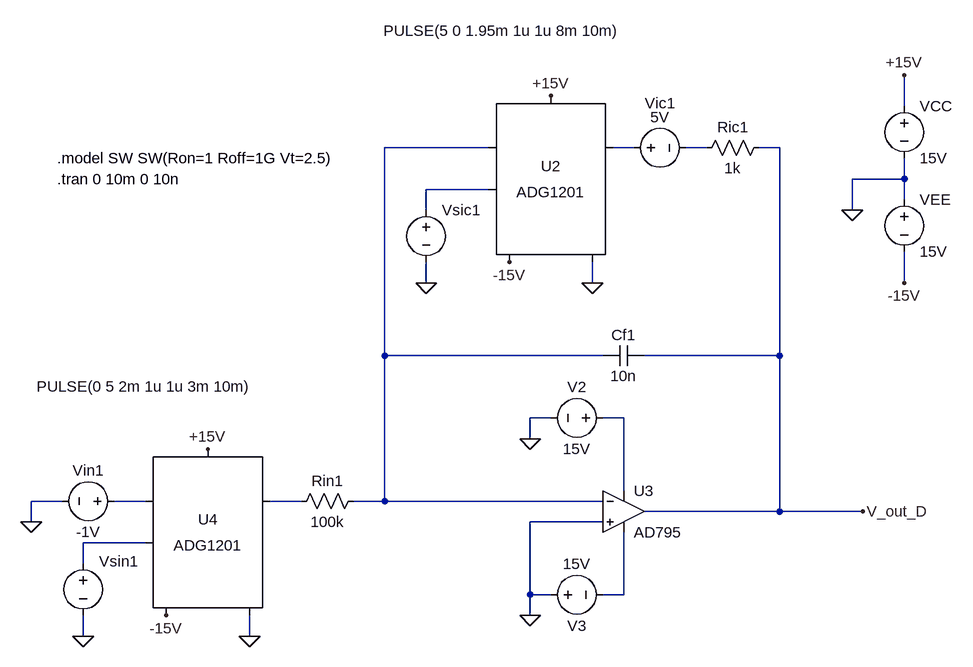
[diagram p0: schematic SIM-ANALOG-011.asc]
SIM-ANALOG-011.asc, the LTspice schematic file:
Version 4.1
SHEET 1 1720 696
WIRE 1648 -256 1648 -304
WIRE 1008 -192 848 -192
WIRE 1232 -192 1200 -192
WIRE 1344 -192 1312 -192
WIRE 1456 -192 1424 -192
WIRE 1648 -144 1648 -176
WIRE 1648 -144 1568 -144
WIRE 1008 -128 912 -128
WIRE 1648 -112 1648 -144
WIRE 912 -96 912 -128
WIRE 1568 -96 1568 -144
WIRE 912 16 912 -16
WIRE 1168 16 1168 -16
WIRE 1648 16 1648 -32
WIRE 848 128 848 -192
WIRE 1184 128 848 128
WIRE 1456 128 1456 -192
WIRE 1456 128 1248 128
WIRE 1104 224 1072 224
WIRE 1216 224 1184 224
WIRE 1072 256 1072 224
WIRE 1216 336 1216 224
WIRE 352 352 304 352
WIRE 480 352 432 352
WIRE 720 352 672 352
WIRE 848 352 848 128
WIRE 848 352 800 352
WIRE 1184 352 848 352
WIRE 1456 368 1456 128
WIRE 1456 368 1248 368
WIRE 1584 368 1456 368
WIRE 304 384 304 352
WIRE 1184 384 1072 384
WIRE 480 416 384 416
WIRE 384 448 384 416
WIRE 1072 496 1072 384
WIRE 1104 496 1072 496
WIRE 1216 496 1216 400
WIRE 1216 496 1184 496
WIRE 1072 528 1072 496
WIRE 384 560 384 528
WIRE 640 560 640 528
FLAG 1168 16 0
FLAG 912 16 0
FLAG 1072 256 0
FLAG 1072 528 0
FLAG 1584 368 V_out_D
FLAG 640 560 0
FLAG 384 560 0
FLAG 304 384 0
FLAG 1568 -96 0
FLAG 1648 16 -15V
FLAG 1648 -304 +15V
FLAG 1104 -272 +15V
FLAG 576 272 +15V
FLAG 1040 -16 -15V
FLAG 512 528 -15V
SYMBOL Switches\\ADG1201 1104 -144 R0
SYMATTR InstName U2
SYMBOL voltage 1216 -192 R270
WINDOW 0 84 56 VBottom 2
WINDOW 3 32 56 VTop 2
WINDOW 123 0 0 Left 0
WINDOW 39 0 0 Left 0
SYMATTR InstName Vic1
SYMATTR Value 5V
SYMBOL res 1440 -208 R90
WINDOW 0 0 56 VBottom 2
WINDOW 3 32 56 VTop 2
SYMATTR InstName Ric1
SYMATTR Value 1k
SYMBOL voltage 912 -112 R0
WINDOW 3 -66 -260 Left 2
WINDOW 123 0 0 Left 0
WINDOW 39 0 0 Left 0
SYMATTR InstName Vsic1
SYMATTR Value PULSE(5 0 1.95m 1u 1u 8m 10m)
SYMBOL cap 1248 112 R90
WINDOW 0 0 32 VBottom 2
WINDOW 3 32 32 VTop 2
SYMATTR InstName Cf1
SYMATTR Value 10n
SYMBOL voltage 1200 224 R90
WINDOW 0 -32 56 VBottom 2
WINDOW 3 32 56 VTop 2
WINDOW 123 0 0 Left 0
WINDOW 39 0 0 Left 0
SYMATTR InstName V2
SYMATTR Value 15V
SYMBOL OpAmps\\AD795 1216 304 R0
SYMATTR InstName U3
SYMBOL voltage 1088 496 R270
WINDOW 0 -32 56 VBottom 2
WINDOW 3 32 56 VTop 2
WINDOW 123 0 0 Left 0
WINDOW 39 0 0 Left 0
SYMATTR InstName V3
SYMATTR Value 15V
SYMBOL res 816 336 R90
WINDOW 0 0 56 VBottom 2
WINDOW 3 32 56 VTop 2
SYMATTR InstName Rin1
SYMATTR Value 100k
SYMBOL Switches\\ADG1201 576 400 R0
SYMATTR InstName U4
SYMBOL voltage 384 432 R0
WINDOW 0 55 28 Bottom 2
WINDOW 3 94 -272 Top 2
WINDOW 123 0 0 Left 0
WINDOW 39 0 0 Left 0
SYMATTR InstName Vsin1
SYMATTR Value PULSE(0 5 2m 1u 1u 3m 10m)
SYMBOL voltage 448 352 R90
WINDOW 0 -32 56 VBottom 2
WINDOW 3 32 56 VTop 2
WINDOW 123 0 0 Left 0
WINDOW 39 0 0 Left 0
SYMATTR InstName Vin1
SYMATTR Value -1V
SYMBOL voltage 1648 -272 R0
WINDOW 123 0 0 Left 0
WINDOW 39 0 0 Left 0
SYMATTR InstName VCC
SYMATTR Value 15V
SYMBOL voltage 1648 -128 R0
WINDOW 123 0 0 Left 0
WINDOW 39 0 0 Left 0
SYMATTR InstName VEE
SYMATTR Value 15V
TEXT 344 -176 Left 2 !.model SW SW(Ron=1 Roff=1G Vt=2.5)
TEXT 344 -144 Left 2 !.tran 0 10m 0 10n

The netlist it stands for:
* SIM-ANALOG-011.asc
X§U2 N004 N002 N001 -15V 0 +15V ADG1201
Vic1 N002 N003 5V
Ric1 V_out_D N003 1k
Vsic1 N004 0 PULSE(5 0 1.95m 1u 1u 8m 10m)
Cf1 V_out_D N001 10n
V2 N005 0 15V
X§U3 0 N001 N005 N009 V_out_D AD795  ; pins In+ In- V+ V- OUT
V3 0 N009 15V
Rin1 N001 N007 100k
X§U4 N008 N007 N006 -15V 0 +15V ADG1201
Vsin1 N008 0 PULSE(0 5 2m 1u 1u 3m 10m)
Vin1 N006 0 -1V
VCC +15V 0 15V
VEE 0 -15V 15V
.model SW SW(Ron=1 Roff=1G Vt=2.5)
.tran 0 10m 0 10n
.lib ADG1201.sub
.lib ADI1.lib
.backanno
.end